# Altium schematic sheet schematic.SchDoc
size A; SheetNumber: 1; SheetTotal: 1
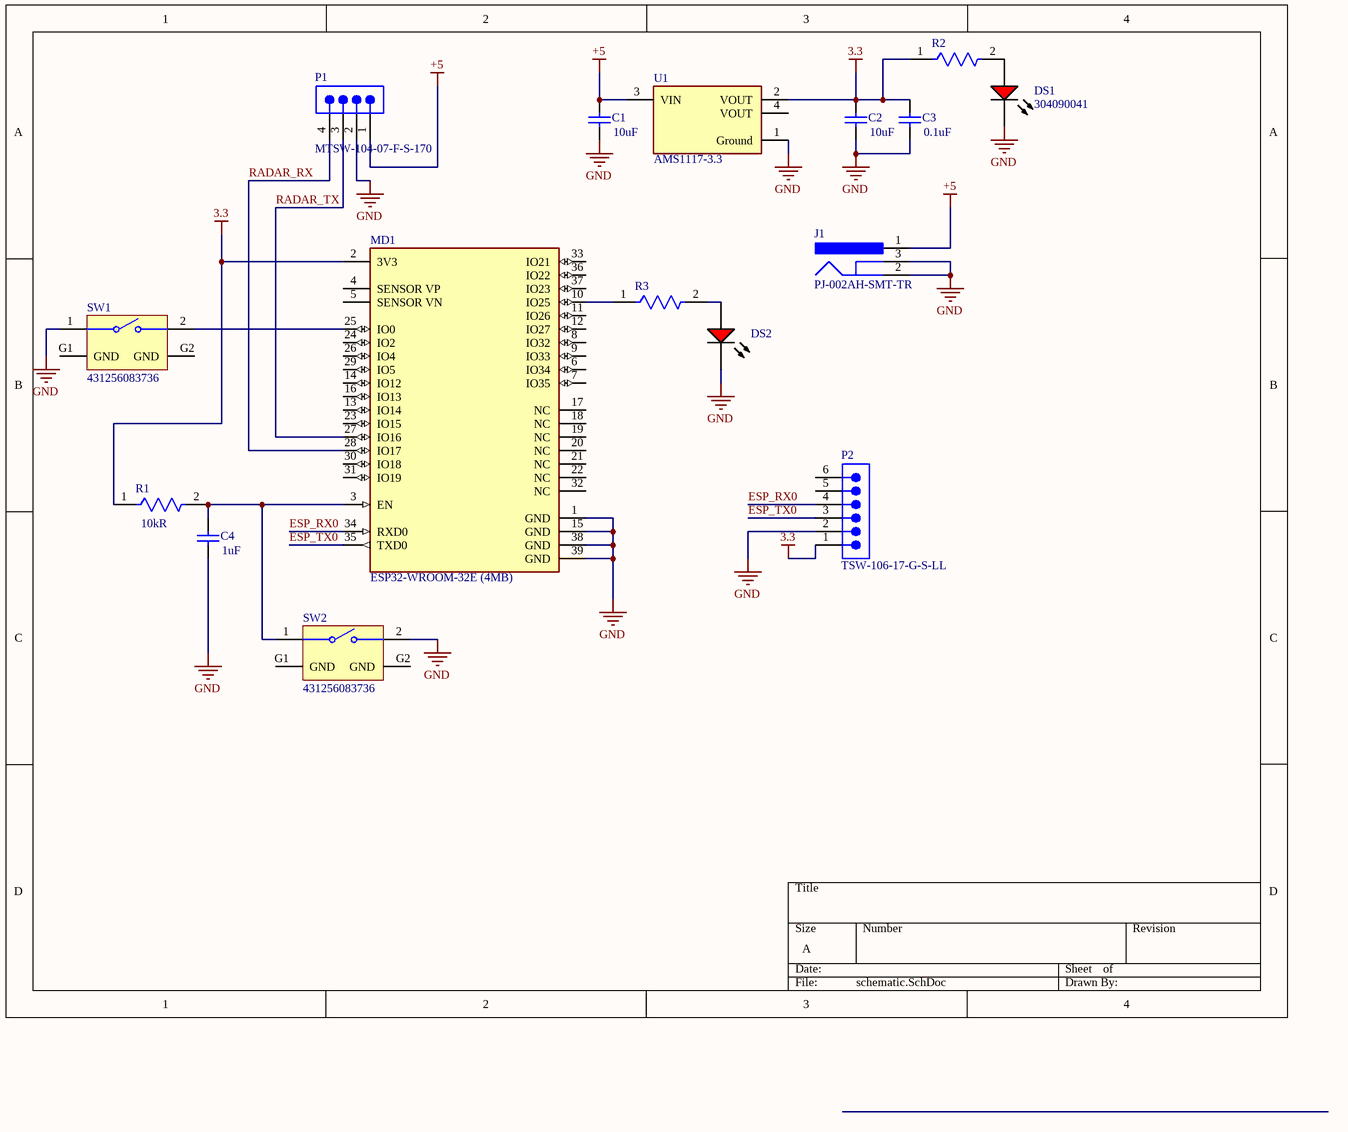
[diagram p0: schematic.SchDoc]

## Parts
C1  capacitance: 10uF  [CAPC2013X140X50ML20T25]  (hidden comment: 08056D106KAT4A)
C2  capacitance: 10uF  [CAPC2013X140X50ML20T25]  (hidden comment: 08056D106KAT4A)
C3  capacitance: 0.1uF  [CAPC2013X140X50ML20T25]  (hidden comment: 08055D104KAT2A)
C4  capacitance: 1uF  [CAPC2013X94X50LL20T25]  (hidden comment: 08053C105MAT2A)
DS1  304090041  [LED-2P-2.28-3MM_A]
DS2  304090041  [LED-2P-2.28-3MM_A]  (value not drawn)
J1  PJ-002AH-SMT-TR  [CUI-PJ-002AH-4_V]
MD1  ESP32-WROOM-32E (4MB)  [FP-ESP32-WROOM-32E_4MB-MFG]
P1  MTSW-104-07-F-S-170  [SMTC-MTSW-104-07-X-S-170]
P2  TSW-106-17-G-S-LL  [SMTC-TSW-106-17-X-S-LL]
R1  Resistance: 10kR  [FP-AT0805-MFG]  (hidden comment: AT0805DRE0710KL)
R2  AT0603FRE07330RL  [FP-AT0603-MFG]  (value not drawn)
R3  AT0603FRE07330RL  [FP-AT0603-MFG]  (value not drawn)
SW1  431256083736  [4312560837x6]
SW2  431256083736  [4312560837x6]
U1  AMS1117-3.3  [FP-AMS1117-IPC_C]

## Nets
3.3: C2.2 C3.2 MD1.2(3V3) P2.1 R1.1 R2.1 U1.2(VOUT)
+5: C1.2 J1.1 P1.1 U1.3(VIN)
GND: C1.1 C2.1 C3.1 C4.1 DS1.2(K) DS2.2(K) J1.2 J1.3 MD1.1(GND) MD1.15(GND) MD1.38(GND) MD1.39(GND) P1.2 P2.2 SW1.1 SW2.2 U1.1(Ground)
ESP_RX0: MD1.34(RXD0) P2.4
ESP_TX0: MD1.35(TXD0) P2.3
RADAR_RX: MD1.28(IO17) P1.4
RADAR_TX: MD1.27(IO16) P1.3
NetC4_2: C4.2 MD1.3(EN) R1.2 SW2.1
NetDS1_1: DS1.1(A) R2.2
NetDS2_1: DS2.1(A) R3.2
NetMD1_10: MD1.10(IO25) R3.1
NetMD1_25: MD1.25(IO0) SW1.2

Not connected (* = marked no-connect by the designer): MD1 4(SENSOR_VP) 5(SENSOR_VN) 6(IO34) 7(IO35) 8(IO32) 9(IO33) 11(IO26) 12(IO27) 13(IO14) 14(IO12) 16(IO13) 17(NC) 18(NC) 19(NC) 20(NC) 21(NC) 22(NC) 23(IO15) 24(IO2) 26(IO4) 29(IO5) 30(IO18) 31(IO19) 32(NC) 33(IO21) 36(IO22) 37(IO23); P2 5 6; SW1 G1(GND) G2(GND); SW2 G1(GND) G2(GND); U1 4(VOUT)

## Library data of the parts
C1 C2 = CMP-2007-04644-1: Manufacturer: AVX Interconnect / Elco; Part Number: 08056D106KAT4A
C3 = CMP-2007-04689-1: Manufacturer: AVX Interconnect / Elco; Part Number: 08055D104KAT2A
C4 = CMP-2007-04238-1: Manufacturer: AVX Interconnect / Elco; Part Number: 08053C105MAT2A
DS1 DS2 = CMP-007-00007-2: Red LED, 80 mW, 30 mA, -25 to 85 degC, 2-Pin THD; Manufacturer: Shenzhen CGX; Package Description: 2-Pin Through Hole Device, Dia 3 mm, Pitch 2.28 mm; Datasheet URL: http://datasheet.octopart.com/304090041-Chengguangxing-datasheet-62330656.pdf; Mounting Technology: TH; Manufacturer URL: http://szcgx.com/; RoHS Compliant: Unknown; Datasheet Version: Sep-14; Case/Package: 304090041; Package Reference: 304090041
J1 = CMP-2000-06896-2: DC Power Jack, Right Angle, -25 to 85 degC, 4-Pin 14.8 x 9 x 11 mm SMD, RoHS, Tape and Reel; Manufacturer: CUIInc.; Brand: CUI; Inside Contact Diameter: 2mm; Voltage Rating: 24V; Insulation Resistance: 100MOhms; Outside Contact Diameter: 6.5mm; Current Rating: 5A; Mounting Angle: Right; Contact Plating: Nickel; Package Description: 4-Pin Surface Mount Device, Body 14.8 x 9 mm, Pitch 6.1 mm; Factory Pack Quantity: 350; Datasheet Version: Rev. 1.03, 11/2012; Operating Temperature Range: -25Cto+85C; Termination Style: SMD/SMT; Product: Jacks; Contact Gender: Male; Product Category: DCPowerConnectors; RoHS: True; Connector Type: DCPowerJack; Packaging: Reel; Contact Material: Brass; Flammability Rating: UL94V-0; Datasheet URL: http://www.cui.com/product/resource/pj-002ah-smt.pdf; Package Reference: PJ-002AH; Manufacturer URL: http://www.cui.com/; PartNumber: PJ-002AH; Mounting Style: SMD/SMT; Mounting Technology: SurfaceMount; Housing Material: Polyamide(PA)
MD1 = CMP-194065-000026-1: RX TXRX MOD WIFI TRACE ANT SMD
P1 = CMP-1024-00106-1: Modified .025" SQ Post Header, Through-hole, Vertical, -55 to 125 degC, 2.54 mm Pitch, 4-Pin, Male, RoHS; Manufacturer: Samtec; Pitch: 2.54 mm; Orientation: Vertical; ComponentLink1Description: Manufacturer URL; ComponentLink2Description: Datasheet; PackageReference: MTSW-104-07-X-S-170; PackageDescription: Assembly .025" [.64] SQ Post Terminal Strip; Temperature Range: -55 to 125 degC; PackageVersion: BI, 2/1987; PartNumber: MTSW-104-07-F-S-170; Mounting Technology: Through-hole; ComponentLink2URL: http://www.samtec.com/documents/webfiles/pdf/MTSW.PDF; ComponentLink3URL: http://www.samtec.com/documents/webfiles/cpdf/MTSW-XXX-XX-X-X-XXXX-XX-XXX-MKT1.pdf; DatasheetVersion: F-214; RoHS: True; ComponentLink3Description: Package Specification; ComponentLink1URL: http://www.samtec.com
P2 = CMP-1024-00391-1: 0.025" SQ Post Header, Through-hole, Vertical, -55 to 125 degC, 2.54 mm Pitch, 6-Pin, Male, RoHS; Manufacturer: Samtec; Pitch: 2.54 mm; ComponentLink3Description: Package Specification; Temperature Range: -55 to 125 degC; ComponentLink1Description: Manufacturer URL; ComponentLink2Description: Datasheet; Orientation: Vertical; DatasheetVersion: F-214; Mounting Technology: Through-hole; RoHS: True; PartNumber: TSW-106-17-G-S-LL; ComponentLink2URL: http://www.samtec.com/documents/webfiles/pdf/TSW_TH.PDF; PackageReference: TSW-106-17-X-S-LL; PackageVersion: DM, 8/1988; ComponentLink3URL: http://www.samtec.com/documents/webfiles/cpdf/TSW-XXX-XX-XXX-X-XX-XXX-MKT.pdf; PackageDescription: .025[0.64] SQ. Post Terminal Strip Assembly; ComponentLink1URL: http://www.samtec.com
R1 = CMP-03412-049031-1: Thin Film Chip Resistors Automotive Grade 10kΩ 0.5% 50ppm/°C 0805; Max Power Dissipation: 125mW; Ratings: AEC-Q200; Length: 0.079inch; Temperature Coefficient: 50ppm/°C; Height: 0.024inch; Min Operating Temperature: -55°C; Case/Package: 0805; Tolerance: 0.5%; RoHS Compliant: Yes; Features: Moisture Resistant; Number of Terminations: 2; Max Operating Temperature: 155°C; Series: AT; Packaging: Tape and Reel; Width: 0.049inch; Resistor Type: Thin Film; Parameter 1: *
R2 R3 = CMP-03412-049869-1: Thin Film Chip Resistors Automotive Grade 330Ω 1% 50ppm/°C 0603; RoHS Compliant: Yes
SW1 SW2 = CMP-1458-00012-4: Tactile Switch, 0.05A, 12Vdc, 360Gf, Tht Rohs Compliant: Yes; Mechanical Life: 200kcycles; Current Rating: 50mA; Switch Travel: 250µm; Switch Function: Off-Mom; Actuator Material: Liquid Crystal Polymer, Polymer; Voltage Rating: 12V; Throw Configuration: SPST; Illumination Type: Non-Illuminated; Insulation Resistance: 100MΩ; Diameter: 3mm; Termination: PC Pin; RoHS: Compliant; Max Operating Temperature: 85°C; Height: 8.35mm; Min Operating Temperature: -40°C; Contact Plating: Silver; Packaging: Bulk
U1 = CMP-209535-000001-1: LDO Voltage Regulators 1A, 3.3V; Manufacturer: Advanced Monolithic Systems; Dropout Voltage: 1.1V; Output Type: Fixed; Nominal Supply Current: 5mA; Max Power Dissipation: 1.2W; Max Supply Voltage: 15V; Number Of Outputs: 1; Standoff Height: 0.64mm; Max Junction Temp: +125°C; Height: 1.8mm; Package: AMS1117; Device Class L2: Power Management ICs; ComponentLink2Description: Datasheet; ComponentLink2URL: http://www.advanced-monolithic.com/pdf/ds1117.pdf; Category: IC; RoHS: TRUE; Automotive: No; Device Class L1: Integrated Circuits (ICs); Output Current: 1A; Device Class L3: Voltage Regulators - Linear; Temperature: -40°C to +125°C; Output Voltage: 3.3V; Manufacturer Part Number: AMS1117-3.3; Temperature Range Low: -40°C; Octopart: https://octopart.com/ams1117-3.3-advanced+monolithic+systems-25899300; Lead Free: Yes; Ipc Land Pattern Name: SOT229P700X180-4; Temperature Range High: +125°C